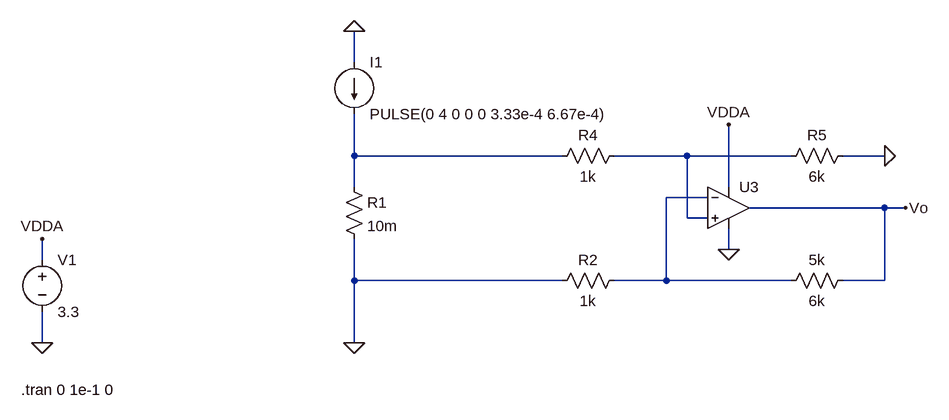
[diagram p0: schematic motor_diff_amp_simulation.asc]
motor_diff_amp_simulation.asc, the LTspice schematic file:
Version 4
SHEET 1 2052 680
WIRE 448 -176 448 -224
WIRE 448 -32 448 -96
WIRE 768 -32 448 -32
WIRE 960 -32 848 -32
WIRE 1120 -32 960 -32
WIRE 1264 -32 1200 -32
WIRE 448 16 448 -32
WIRE 1024 16 1024 -80
WIRE 992 32 928 32
WIRE 1264 48 1056 48
WIRE 1296 48 1264 48
WIRE 960 64 960 -32
WIRE 992 64 960 64
WIRE 1024 112 1024 80
WIRE -32 128 -32 96
WIRE 448 160 448 96
WIRE 768 160 448 160
WIRE 928 160 928 32
WIRE 928 160 848 160
WIRE 1120 160 928 160
WIRE 1264 160 1264 48
WIRE 1264 160 1200 160
WIRE -32 256 -32 208
WIRE 448 256 448 160
FLAG -32 256 0
FLAG -32 96 VDDA
FLAG 1024 -80 VDDA
FLAG 1024 112 0
FLAG 448 256 0
FLAG 448 -224 0
FLAG 1264 -32 0
FLAG 1296 48 Vo
SYMBOL voltage -32 112 R0
WINDOW 123 0 0 Left 0
WINDOW 39 0 0 Left 0
SYMATTR InstName V1
SYMATTR Value 3.3
SYMBOL res 432 0 R0
SYMATTR InstName R1
SYMATTR Value 10m
SYMBOL current 448 -176 R0
WINDOW 39 0 0 Left 0
SYMATTR InstName I1
SYMATTR Value PULSE(0 4 0 0 0 3.33e-4 6.67e-4)
SYMATTR Value2 AC 1
SYMBOL OpAmps\\UniversalOpAmp2 1024 48 R0
SYMATTR InstName U3
SYMATTR Value2 Avol=3.1623e4 GBW=18Meg Slew=10Meg
SYMATTR SpiceLine Ilimit=18m Rail=0 Vos=0
SYMBOL res 864 -48 R90
WINDOW 0 0 56 VBottom 2
WINDOW 3 32 56 VTop 2
SYMATTR InstName R4
SYMATTR Value 1k
SYMBOL res 1216 -48 R90
WINDOW 0 0 56 VBottom 2
WINDOW 3 32 56 VTop 2
SYMATTR InstName R5
SYMATTR Value 6k
SYMBOL res 864 144 R90
WINDOW 0 0 56 VBottom 2
WINDOW 3 32 56 VTop 2
SYMATTR InstName R2
SYMATTR Value 1k
SYMBOL res 1216 144 R90
WINDOW 0 0 56 VBottom 2
WINDOW 3 32 56 VTop 2
SYMATTR InstName 5k
SYMATTR Value 6k
TEXT -64 328 Left 2 !.tran 0 1e-1 0

The netlist it stands for:
* motor_diff_amp_simulation.asc
V1 VDDA 0 3.3
R1 N001 0 10m
I1 0 N001 PULSE(0 4 0 0 0 3.33e-4 6.67e-4) AC 1
XU3 N002 N003 VDDA 0 Vo level2 Avol=3.1623e4 GBW=18Meg Slew=10Meg Ilimit=18m Rail=0 Vos=0 En=0 Enk=0 In=0 Ink=0 Rin=500Meg  ; pins In+ In- V+ V- OUT
R4 N002 N001 1k
R5 0 N002 6k
R2 N003 0 1k
R§5k Vo N003 6k
.tran 0 1e-1 0
.lib UniversalOpAmp2.lib
.backanno
.end